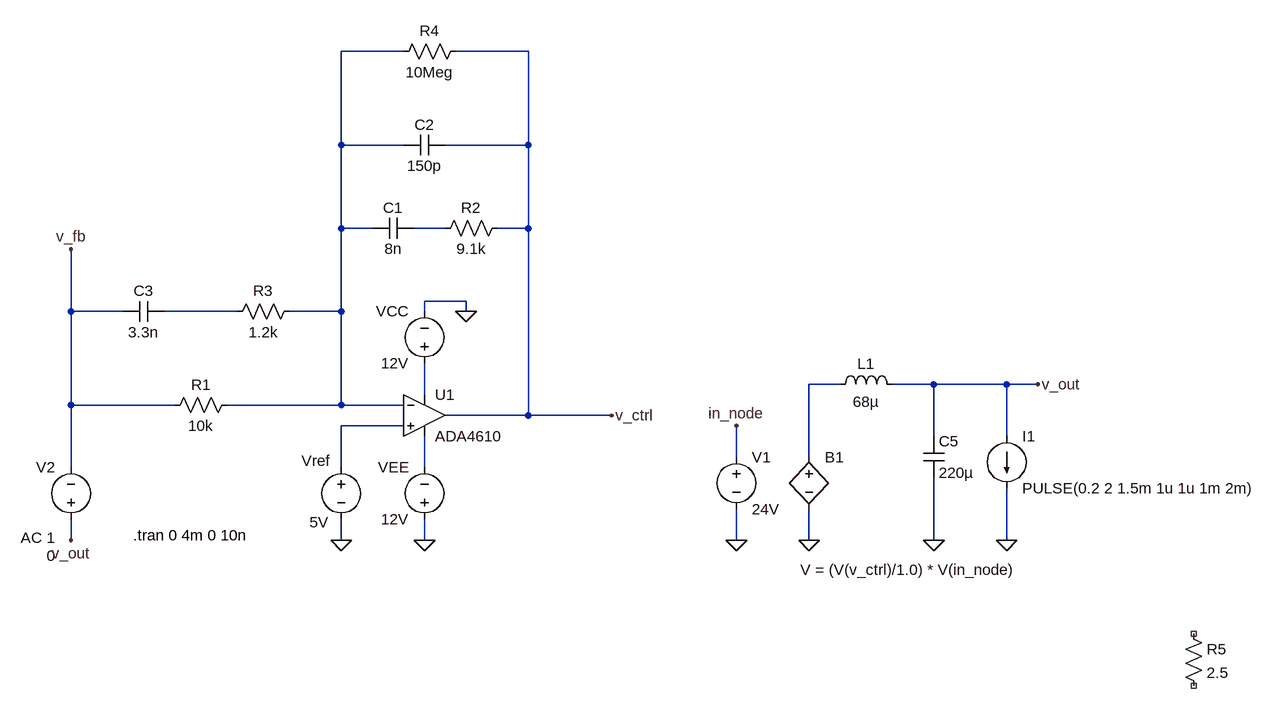
[diagram p0: schematic SIM-ANALOG-006.asc]
SIM-ANALOG-006.asc, the LTspice schematic file:
Version 4.1
SHEET 1 1684 680
WIRE 208 -416 112 -416
WIRE 400 -416 288 -416
WIRE 112 -272 112 -416
WIRE 208 -272 112 -272
WIRE 400 -272 400 -416
WIRE 400 -272 272 -272
WIRE 112 -144 112 -272
WIRE 160 -144 112 -144
WIRE 272 -144 224 -144
WIRE 400 -144 400 -272
WIRE 400 -144 352 -144
WIRE 304 -32 240 -32
WIRE -304 -16 -304 -112
WIRE -224 -16 -304 -16
WIRE -48 -16 -160 -16
WIRE 112 -16 112 -144
WIRE 112 -16 32 -16
WIRE 240 -16 240 -32
WIRE 304 -16 304 -32
WIRE 880 96 832 96
WIRE 1024 96 960 96
WIRE 1136 96 1024 96
WIRE 1184 96 1136 96
WIRE 240 112 240 64
WIRE -304 128 -304 -16
WIRE -144 128 -304 128
WIRE 112 128 112 -16
WIRE 112 128 -64 128
WIRE 208 128 112 128
WIRE 400 144 400 -144
WIRE 400 144 272 144
WIRE 528 144 400 144
WIRE 208 160 112 160
WIRE 1024 176 1024 96
WIRE 1136 176 1136 96
WIRE 720 208 720 160
WIRE 832 208 832 96
WIRE -304 224 -304 128
WIRE 112 224 112 160
WIRE 240 224 240 176
WIRE -304 336 -304 304
WIRE 112 336 112 304
WIRE 240 336 240 304
WIRE 720 336 720 288
WIRE 832 336 832 288
WIRE 1024 336 1024 240
WIRE 1136 336 1136 256
FLAG 304 -16 0
FLAG 240 336 0
FLAG 528 144 v_ctrl
FLAG 720 160 in_node
FLAG 720 336 0
FLAG 832 336 0
FLAG 1024 336 0
FLAG 1136 336 0
FLAG 112 336 0
FLAG 1184 96 v_out
FLAG -304 336 v_out
FLAG -304 -112 v_fb
SYMBOL OpAmps\\ADA4610 240 80 R0
SYMATTR InstName U1
SYMBOL voltage 240 80 R180
WINDOW 0 24 96 Left 2
WINDOW 3 24 16 Left 2
WINDOW 123 0 0 Left 0
WINDOW 39 0 0 Left 0
SYMATTR InstName VCC
SYMATTR Value 12V
SYMBOL voltage 240 320 R180
WINDOW 0 24 96 Left 2
WINDOW 3 24 16 Left 2
WINDOW 123 0 0 Left 0
WINDOW 39 0 0 Left 0
SYMATTR InstName VEE
SYMATTR Value 12V
SYMBOL voltage 112 208 R0
WINDOW 0 -61 6 Left 2
WINDOW 3 -49 100 Left 2
WINDOW 123 0 0 Left 0
WINDOW 39 0 0 Left 0
SYMATTR InstName Vref
SYMATTR Value 5V
SYMBOL res -48 112 R90
WINDOW 0 0 56 VBottom 2
WINDOW 3 32 56 VTop 2
SYMATTR InstName R1
SYMATTR Value 10k
SYMATTR SpiceLine tol=0.1
SYMBOL res 368 -160 R90
WINDOW 0 0 56 VBottom 2
WINDOW 3 32 56 VTop 2
SYMATTR InstName R2
SYMATTR Value 9.1k
SYMBOL cap 224 -160 R90
WINDOW 0 0 32 VBottom 2
WINDOW 3 32 32 VTop 2
SYMATTR InstName C1
SYMATTR Value 8n
SYMBOL cap 272 -288 R90
WINDOW 0 0 32 VBottom 2
WINDOW 3 32 32 VTop 2
SYMATTR InstName C2
SYMATTR Value 150p
SYMBOL voltage 720 192 R0
WINDOW 123 0 0 Left 0
WINDOW 39 0 0 Left 0
SYMATTR InstName V1
SYMATTR Value 24V
SYMBOL bv 832 192 R0
WINDOW 3 -13 189 Left 2
SYMATTR Value V = (V(v_ctrl)/1.0) * V(in_node)
SYMATTR InstName B1
SYMBOL ind 864 112 R270
WINDOW 0 32 56 VTop 2
WINDOW 3 5 56 VBottom 2
SYMATTR InstName L1
SYMATTR Value 68µ
SYMATTR SpiceLine Rser=25m
SYMBOL cap 1008 176 R0
SYMATTR InstName C5
SYMATTR Value 220µ
SYMATTR SpiceLine Rser=25m
SYMBOL res 1408 464 R0
SYMATTR InstName R5
SYMATTR Value 2.5
SYMBOL voltage -304 320 R180
WINDOW 0 24 96 Left 2
WINDOW 3 24 -40 Left 2
WINDOW 123 24 -12 Left 2
WINDOW 39 0 0 Left 0
SYMATTR InstName V2
SYMATTR Value 0
SYMATTR Value2 AC 1
SYMBOL res 304 -432 R90
WINDOW 0 0 56 VBottom 2
WINDOW 3 32 56 VTop 2
SYMATTR InstName R4
SYMATTR Value 10Meg
SYMBOL res 48 -32 R90
WINDOW 0 0 56 VBottom 2
WINDOW 3 32 56 VTop 2
SYMATTR InstName R3
SYMATTR Value 1.2k
SYMBOL cap -160 -32 R90
WINDOW 0 0 32 VBottom 2
WINDOW 3 32 32 VTop 2
SYMATTR InstName C3
SYMATTR Value 3.3n
SYMATTR SpiceLine Rser=25m
SYMBOL current 1136 176 R0
WINDOW 123 0 0 Left 0
WINDOW 39 0 0 Left 0
SYMATTR InstName I1
SYMATTR Value PULSE(0.2 2 1.5m 1u 1u 1m 2m)
TEXT -208 328 Left 2 !.tran 0 4m 0 10n

The netlist it stands for:
* SIM-ANALOG-006.asc
X§U1 N006 N001 N005 N007 v_ctrl ADA4610  ; pins In+ In- V+ V- OUT
VCC N005 0 12V
VEE 0 N007 12V
Vref N006 0 5V
R1 N001 v_fb 10k tol=0.1
R2 v_ctrl N002 9.1k
C1 N002 N001 8n
C2 v_ctrl N001 150p
V1 in_node 0 24V
B1 N004 0 V = (V(v_ctrl)/1.0) * V(in_node)
L1 N004 v_out 68µ Rser=25m
C5 v_out 0 220µ Rser=25m
R5 NC_01 NC_02 2.5
V2 v_out v_fb 0 AC 1
R4 v_ctrl N001 10Meg
R3 N001 N003 1.2k
C3 N003 v_fb 3.3n Rser=25m
I1 v_out 0 PULSE(0.2 2 1.5m 1u 1u 1m 2m)
.tran 0 4m 0 10n
.backanno
.end